# Altium project IOT_V1.5.PrjPcb
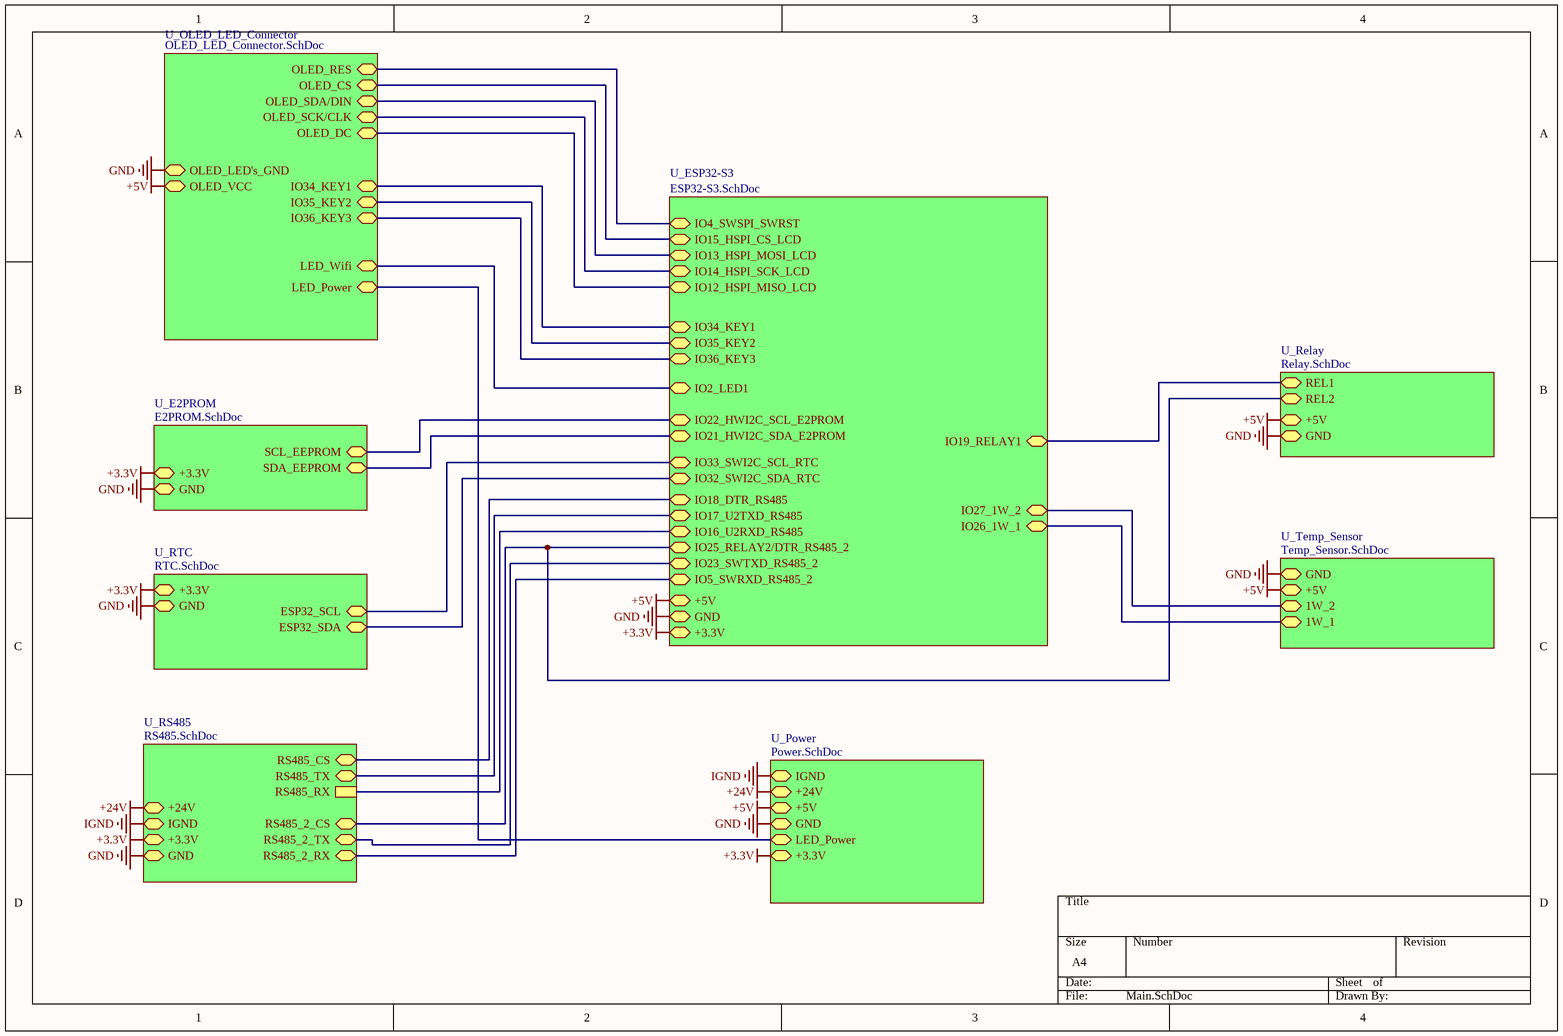
[diagram p0: Main.SchDoc]
9 sheets, 108 parts. Net scope: hierarchical (ports join the sheet entries above them; power ports are global).
Board file: IOTv1.5.PcbDoc
Sheets:
  Main.SchDoc
    U_E2PROM = E2PROM.SchDoc
    U_Power = Power.SchDoc
    U_Relay = Relay.SchDoc
    U_RS485 = RS485.SchDoc
    U_RTC = RTC.SchDoc
    U_Temp_Sensor = Temp_Sensor.SchDoc
    U_OLED_LED_Connector = OLED_LED_Connector.SchDoc
    U_ESP32-S3 = ESP32-S3.SchDoc

## Sheet Main.SchDoc
size A4; SheetNumber: 1; SheetTotal: 12

### Sub-sheets
U_E2PROM = E2PROM.SchDoc: SCL_EEPROM (bidir), SDA_EEPROM (bidir), +3.3V (bidir), GND (bidir)
U_ESP32-S3 = ESP32-S3.SchDoc: IO18_DTR_RS485 (bidir), IO17_U2TXD_RS485 (bidir), IO16_U2RXD_RS485 (bidir), IO22_HWI2C_SCL_E2PROM (bidir), IO21_HWI2C_SDA_E2PROM (bidir), IO32_SWI2C_SDA_RTC (bidir), IO4_SWSPI_SWRST (bidir), IO15_HSPI_CS_LCD (bidir), IO13_HSPI_MOSI_LCD (bidir), IO14_HSPI_SCK_LCD (bidir), IO33_SWI2C_SCL_RTC (bidir), IO2_LED1 (bidir), IO35_KEY2 (bidir), IO36_KEY3 (bidir), IO34_KEY1 (bidir), IO12_HSPI_MISO_LCD (bidir), IO19_RELAY1 (bidir), IO26_1W_1 (bidir), IO27_1W_2 (bidir), +3.3V (bidir), GND (bidir), +5V (bidir), IO25_RELAY2/DTR_RS485_2 (bidir), IO23_SWTXD_RS485_2 (bidir), IO5_SWRXD_RS485_2 (bidir)
U_OLED_LED_Connector = OLED_LED_Connector.SchDoc: OLED_LED's_GND (bidir), OLED_VCC (bidir), OLED_SCK/CLK (bidir), OLED_SDA/DIN (bidir), OLED_RES (bidir), OLED_DC (bidir), OLED_CS (bidir), LED_Power (bidir), LED_Wifi (bidir), IO34_KEY1 (bidir), IO35_KEY2 (bidir), IO36_KEY3 (bidir)
U_Power = Power.SchDoc: IGND (bidir), +24V (bidir), +5V (bidir), GND (bidir), LED_Power (bidir), +3.3V (bidir)
U_Relay = Relay.SchDoc: REL1 (bidir), REL2 (bidir), +5V (bidir), GND (bidir)
U_RS485 = RS485.SchDoc: RS485_CS (bidir), RS485_TX (bidir), RS485_RX, +24V (bidir), IGND (bidir), +3.3V (bidir), GND (bidir), RS485_2_TX (bidir), RS485_2_RX (bidir), RS485_2_CS (bidir)
U_RTC = RTC.SchDoc: +3.3V (bidir), GND (bidir), ESP32_SDA (bidir), ESP32_SCL (bidir)
U_Temp_Sensor = Temp_Sensor.SchDoc: GND (bidir), +5V (bidir), 1W_2 (bidir), 1W_1 (bidir)

### Nets
+3.3V: sheet U_E2PROM/+3.3V, sheet U_Power/LED_Power, sheet U_Power/+3.3V, sheet U_RS485/+3.3V, sheet U_RTC/+3.3V, sheet U_OLED_LED_Connector/LED_Power, sheet U_ESP32-S3/+3.3V
+5V: sheet U_Power/+5V, sheet U_Relay/+5V, sheet U_Temp_Sensor/+5V, sheet U_OLED_LED_Connector/OLED_VCC, sheet U_ESP32-S3/+5V  [project net VCC]
+24V: sheet U_Power/+24V, sheet U_RS485/+24V
GND: sheet U_E2PROM/GND, sheet U_Power/GND, sheet U_Relay/GND, sheet U_RS485/GND, sheet U_RTC/GND, sheet U_Temp_Sensor/GND, sheet U_OLED_LED_Connector/OLED_LED's_GND, sheet U_ESP32-S3/GND
IGND: sheet U_Power/IGND, sheet U_RS485/IGND
1W_1: sheet U_Temp_Sensor/1W_1, sheet U_ESP32-S3/IO26_1W_1
1W_2: sheet U_Temp_Sensor/1W_2, sheet U_ESP32-S3/IO27_1W_2
ESP32_SCL: sheet U_RTC/ESP32_SCL, sheet U_ESP32-S3/IO33_SWI2C_SCL_RTC
ESP32_SDA: sheet U_RTC/ESP32_SDA, sheet U_ESP32-S3/IO32_SWI2C_SDA_RTC
IO2: sheet U_OLED_LED_Connector/LED_Wifi, sheet U_ESP32-S3/IO2_LED1
IO4: sheet U_OLED_LED_Connector/OLED_RES, sheet U_ESP32-S3/IO4_SWSPI_SWRST
IO5: sheet U_RS485/RS485_2_RX, sheet U_ESP32-S3/IO5_SWRXD_RS485_2
IO12: sheet U_OLED_LED_Connector/OLED_DC, sheet U_ESP32-S3/IO12_HSPI_MISO_LCD
IO13: sheet U_OLED_LED_Connector/OLED_SDA/DIN, sheet U_ESP32-S3/IO13_HSPI_MOSI_LCD
IO14: sheet U_OLED_LED_Connector/OLED_SCK/CLK, sheet U_ESP32-S3/IO14_HSPI_SCK_LCD
IO15: sheet U_OLED_LED_Connector/OLED_CS, sheet U_ESP32-S3/IO15_HSPI_CS_LCD
IO16: sheet U_RS485/RS485_RX, sheet U_ESP32-S3/IO16_U2RXD_RS485
IO17: sheet U_RS485/RS485_TX, sheet U_ESP32-S3/IO17_U2TXD_RS485
IO18: sheet U_RS485/RS485_CS, sheet U_ESP32-S3/IO18_DTR_RS485
IO19: sheet U_Relay/REL1, sheet U_ESP32-S3/IO19_RELAY1
IO21: sheet U_E2PROM/SDA_EEPROM, sheet U_ESP32-S3/IO21_HWI2C_SDA_E2PROM
IO22: sheet U_E2PROM/SCL_EEPROM, sheet U_ESP32-S3/IO22_HWI2C_SCL_E2PROM
IO23: sheet U_RS485/RS485_2_TX, sheet U_ESP32-S3/IO23_SWTXD_RS485_2
IO25: sheet U_Relay/REL2, sheet U_RS485/RS485_2_CS, sheet U_ESP32-S3/IO25_RELAY2/DTR_RS485_2
IO34: sheet U_OLED_LED_Connector/IO34_KEY1, sheet U_ESP32-S3/IO34_KEY1
IO35: sheet U_OLED_LED_Connector/IO35_KEY2, sheet U_ESP32-S3/IO35_KEY2
IO36: sheet U_OLED_LED_Connector/IO36_KEY3, sheet U_ESP32-S3/IO36_KEY3

## Sheet E2PROM.SchDoc
size 300 x 200 mm; SheetNumber: 7; SheetTotal: 11
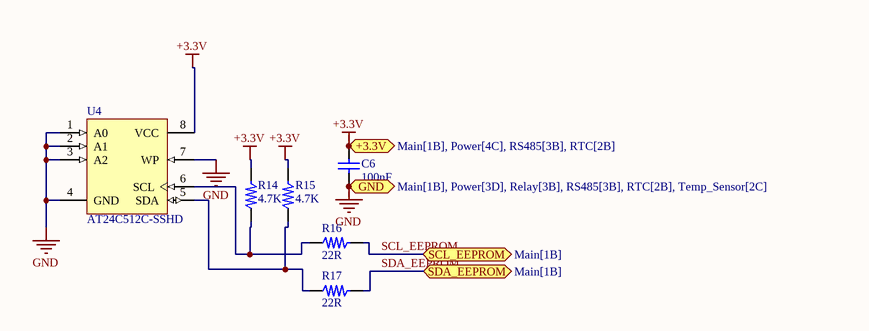
[diagram p1: E2PROM.SchDoc]

### Parts
C6  100nF  [C0805]
R14  4.7K  [R0805]
R15  4.7K  [R0805]
R16  22R  [R0805]
R17  22R  [R0805]
U4  AT24C512C-SSHD  [8S1_N]

### Ports
+3.3V (bidir, see Main[1B], Power[4C], RS485[3B], RTC[2B]), GND (bidir, see Main[1B], Power[3D], Relay[3B], RS485[3B], RTC[2B], Temp_Sensor[2C]), SCL_EEPROM (bidir, see Main[1B]), SDA_EEPROM (bidir, see Main[1B])

### Nets
+3.3V: C6.2 R14.2 R15.2 U4.8(VCC) ; port +3.3V
GND: C6.1 U4.1(A0) U4.2(A1) U4.3(A2) U4.4(GND) U4.7(WP) ; port GND
SCL_EEPROM: R16.2 ; port SCL_EEPROM  [project net IO22]
SDA_EEPROM: R17.2 ; port SDA_EEPROM  [project net IO21]
NetR14_1: R14.1 R16.1 U4.6(SCL)
NetR15_1: R15.1 R17.1 U4.5(SDA)

### Library data of the parts
C6 = 2-Cap: Bipolar Capacitor; Type: MKT
R14-R17 = myRes_1
  R14 R15: Value: 4.7K
  R16 R17: Value: 22R
U4 = AT24C01BN-SP25-B: 1Kbit (128 x 8), 2-wire Bus Automotive Serial EEPROM with Write Protect, 2.5V, 8-Pin SOIC, Bulk; Published: 20-Sep-2010; DatasheetVersion: 8517C,  Jan-2009; PackageVersion: revC, Mar-2005; PackageReference: 8S1; Publisher: Altium Limited; PackageDescription: 8-Lead (0.150" Wide Body), Plastic Gull Wing Small Outline (JEDEC SOIC); Code_JEDEC: MS-012-AA; Code_IPC: SOIC127P600-8; ComponentLink1Description: Manufacturer Link; ComponentLink1URL: http://www.atmel.com/products/serial/default.asp; ComponentLink2Description: Datasheet; ComponentLink2URL: http://www.atmel.com/dyn/resources/prod_documents/doc8517.pdf; ComponentLink3Description: Atmel.com Home; ComponentLink3URL: http://www.atmel.com

## Sheet Power.SchDoc
size 300 x 200 mm; SheetNumber: 12; SheetTotal: 11
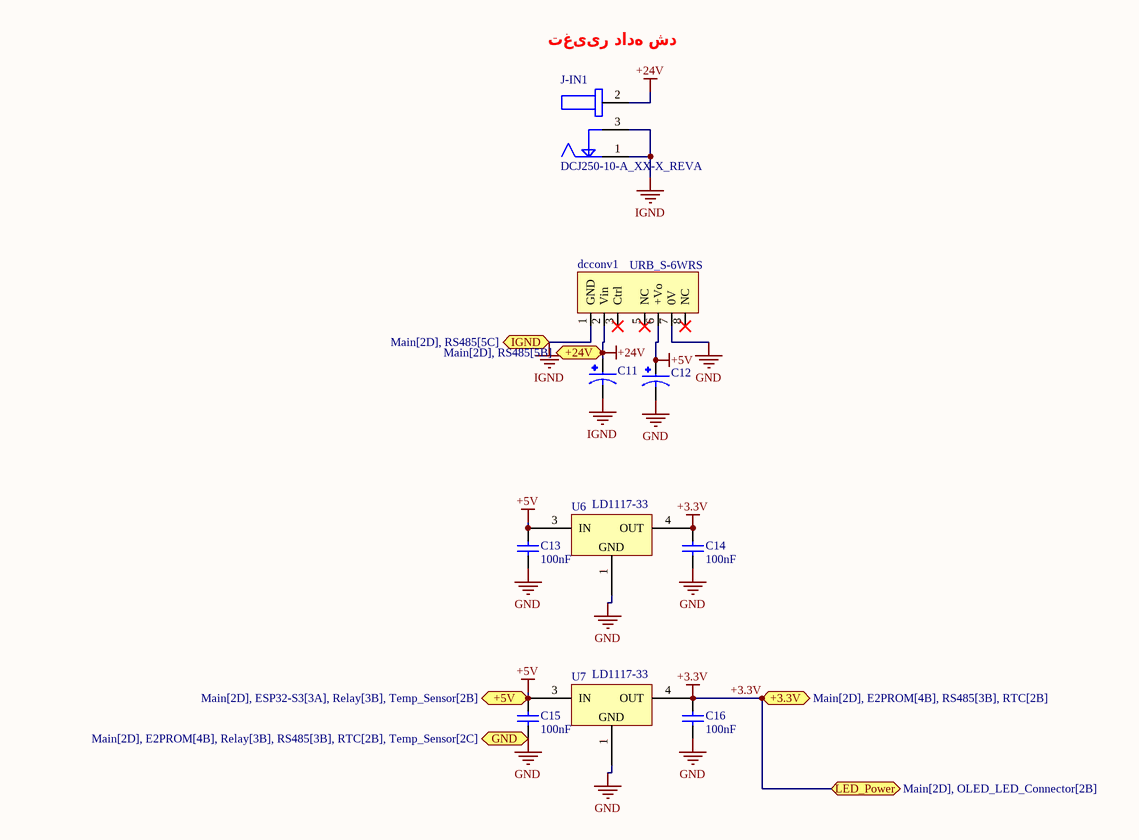
[diagram p2: Power.SchDoc]

### Parts
C11  CAP_EEEFKJ101V  [CAP_EEEFK1J101V]  (value not drawn)
C12  CAP_EEE1EA220AP  [CAP_EEE1EA220AP]  (value not drawn)
C13  100nF  [0805]
C14  100nF  [0805]
C15  100nF  [0805]
C16  100nF  [0805]
dcconv1  URB_S-6WRS  [DCDC]
J-IN1  DCJ250-10-A_XX-X_REVA  [dc power jack]
U6  LD1117-33  [TO-252]
U7  LD1117-33  [TO-252]

### Ports
+3.3V (bidir, see Main[2D], E2PROM[4B], RS485[3B], RTC[2B]), +5V (bidir, see Main[2D], ESP32-S3[3A], Relay[3B], Temp_Sensor[2B]), +24V (bidir, see Main[2D], RS485[5B]), GND (bidir, see Main[2D], E2PROM[4B], Relay[3B], RS485[3B], RTC[2B], Temp_Sensor[2C]), IGND (bidir, see Main[2D], RS485[5C]), LED_Power (bidir, see Main[2D], OLED_LED_Connector[2B])

### Nets
+3.3V: C14.2 C16.2 U6.4(OUT) U7.4(OUT) ; port LED_Power, port +3.3V
+5V: C12.1 C13.2 C15.2 dcconv1.6(+Vo) U6.3(IN) U7.3(IN) ; port +5V  [project net VCC]
+24V: C11.1 dcconv1.2(Vin) J-IN1.2 ; port +24V
GND: C12.2 C13.1 C14.1 C15.1 C16.1 dcconv1.7(0V) U6.1(GND) U7.1(GND) ; port GND
IGND: C11.2 dcconv1.1(GND) J-IN1.1 J-IN1.3 ; port IGND

Not connected (* = marked no-connect by the designer): dcconv1 3(Ctrl)* 5(NC)* 8(NC)*

### Notes on the sheet
- (near J-IN1) تغییر داده شد

### Library data of the parts
C13-C16 = 2-Cap: Bipolar Capacitor; Type: MKT
J-IN1 = DCJ250-10-A_XX-X_REVA: Power Barrel Connector Jack 2.55mm ID _0.100_, 5.50mm OD _0.217_ Through Hole, Right Angle; MP: DCJ250-10-A-K1-K; MF: Global Connector Technology; Availability: Unavailable; Package: None; Value: *; Price: None; SnapEDA_Link: https://www.snapeda.com/parts/DCJ250-10-A-K1-K/Global%20Connector%20Technology/view-part/813036/?ref=snap
U6 U7 = LD1117-33: 3.3V Regulator

## Sheet Relay.SchDoc
size 300 x 200 mm; SheetNumber: 8; SheetTotal: 10
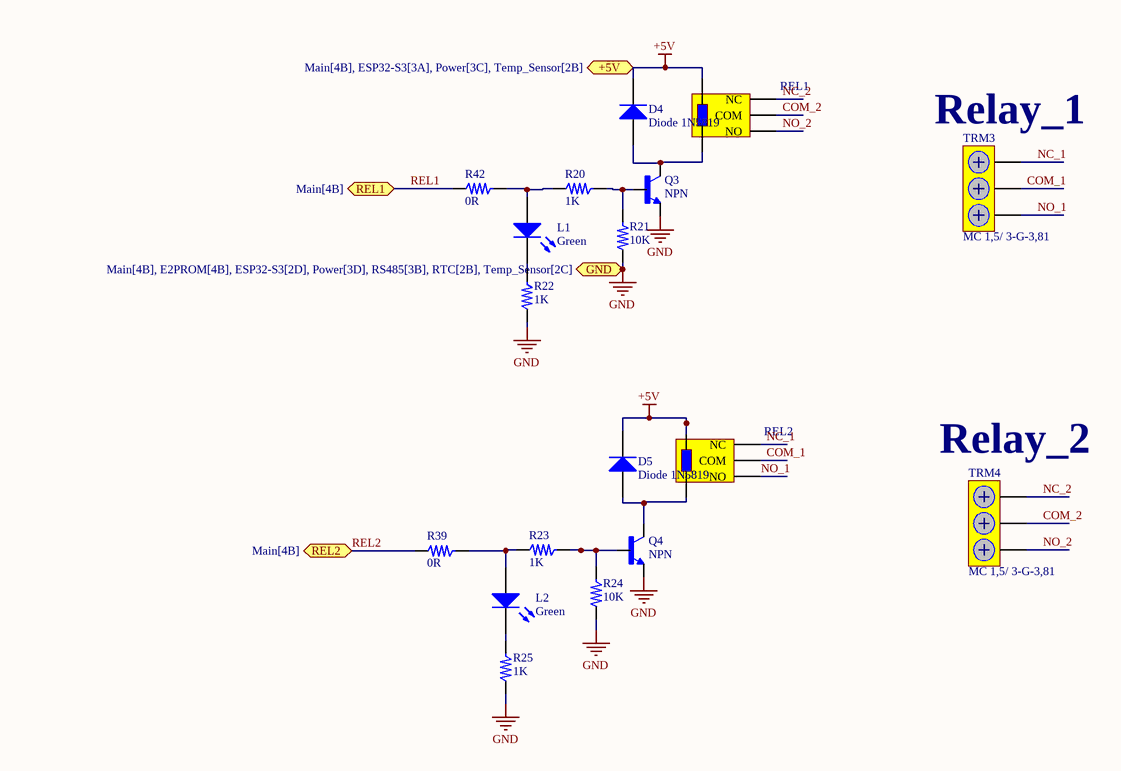
[diagram p3: Relay.SchDoc]

### Parts
D4  Diode 1N5819  [DO-214AA]
D5  Diode 1N5819  [DO-214AA]
L1  Green  [LED-1]
L2  Green  [LED-1]
Q3  NPN  [MMBT2222A]
Q4  NPN  [MMBT2222A]
R20  1K  [R0805]
R21  10K  [R0805]
R22  1K  [R0805]
R23  1K  [R0805]
R24  10K  [R0805]
R25  1K  [R0805]
R39  0R  [R0805]
R42  0R  [R0805]
REL1  Milon mini 5v relay  [HLS-T78-DC5V]  (value not drawn)
REL2  Milon mini 5v relay  [HLS-T78-DC5V]  (value not drawn)
TRM3  MC 1,5/ 3-G-3,81  [MC 1,5/ 3-G-3,81]
TRM4  MC 1,5/ 3-G-3,81  [MC 1,5/ 3-G-3,81]

### Ports
+5V (bidir, see Main[4B], ESP32-S3[3A], Power[3C], Temp_Sensor[2B]), GND (bidir, see Main[4B], E2PROM[4B], ESP32-S3[2D], Power[3D], RS485[3B], RTC[2B], Temp_Sensor[2C]), REL1 (bidir, see Main[4B]), REL2 (bidir, see Main[4B])

### Nets
+5V: D4.2(K) D5.2(K) REL1.3(Coil) REL2.3(Coil) ; port +5V  [project net VCC]
GND: Q3.2(E) Q4.2(E) R21.1 R22.1 R24.1 R25.1 ; port GND
COM_1: REL2.1(COM) TRM3.2
COM_2: REL1.1(COM) TRM4.2
NC_1: REL2.5(NC) TRM3.1
NC_2: REL1.5(NC) TRM4.1
NO_1: REL2.4(NO) TRM3.3
NO_2: REL1.4(NO) TRM4.3
REL1: R42.1 ; port REL1  [project net IO19]
REL2: R39.1 ; port REL2  [project net IO25]
NetD4_1: D4.1(A) Q3.3(C) REL1.2(Coil)
NetD5_1: D5.1(A) Q4.3(C) REL2.2(Coil)
NetL1_1: L1.1(A) R20.1 R42.2
NetL1_2: L1.2(K) R22.2
NetL2_1: L2.1(A) R23.1 R39.2
NetL2_2: L2.2(K) R25.2
NetQ3_1: Q3.1(B) R20.2 R21.2
NetQ4_1: Q4.1(B) R23.2 R24.2

### Notes on the sheet
- (near TRM3) Relay_1
- (near TRM4) Relay_2

### Library data of the parts
D4 D5 = Diode 1N4148: High Conductance Fast Diode; Published: 8-Jun-2000; LatestRevisionDate: 17-Jul-2002; LatestRevisionNote: Re-released for DXP Platform.; DatasheetVersion: 1997; PackageReference: DO-35; Publisher: Altium Limited; PackageDescription: Diode, Axial; Body 3.8 x 1.9 mm (LxDia. max), Lead Dia. 0.53 mm (max); Code_JEDEC: DO-204-AH; ComponentLink1Description: Manufacturer Link; ComponentLink1URL: http://www.fairchildsemi.com/; ComponentLink2Description: Datasheet; ComponentLink2URL: http://www.fairchildsemi.com/ds/1N%2F1N4148.pdf
L1 L2 = LED1_1: LEd 3 mil; Published: 8-Jun-2000; LatestRevisionDate: 08-Jul-2005; LatestRevisionNote: Mech Layer 1 removed.; PackageReference: LED-1; Publisher: Altium Limited; PackageDescription: LED; 2 Leads
Q3 Q4 = MMBT2222A
R20-R25 R39 R42 = myRes_1
  R20 R22 R23 R25: Value: 1K
  R21 R24: Value: 10K
  R39 R42: Value: 0R
REL1 REL2 = HLS-T78

## Sheet RS485.SchDoc
size 300 x 200 mm; SheetNumber: 3; SheetTotal: 10
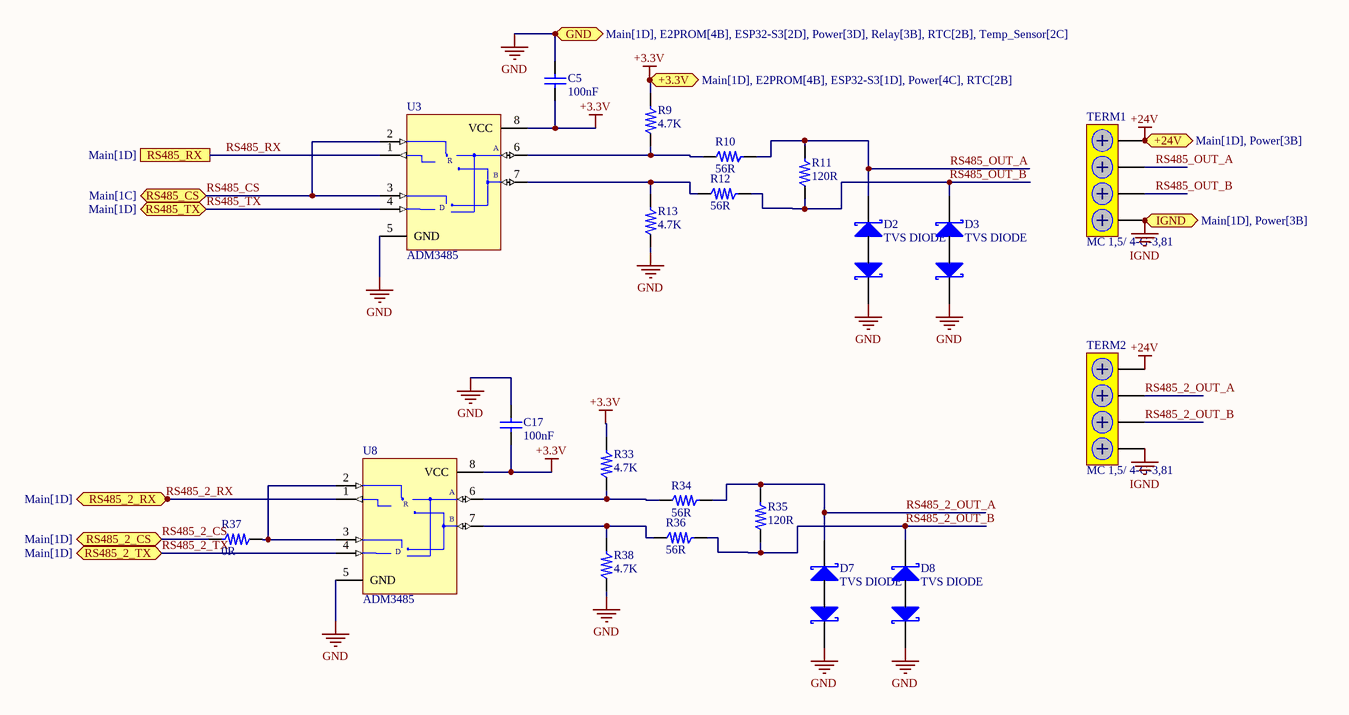
[diagram p4: RS485.SchDoc]

### Parts
C5  100nF  [0805]
C17  100nF  [0805]
D2  TVS DIODE  [DO-214AA]
D3  TVS DIODE  [DO-214AA]
D7  TVS DIODE  [DO-214AA]
D8  TVS DIODE  [DO-214AA]
R9  4.7K  [R0805]
R10  56R  [R0805]
R11  120R  [R0805]
R12  56R  [R0805]
R13  4.7K  [R0805]
R33  4.7K  [R0805]
R34  56R  [R0805]
R35  120R  [R0805]
R36  56R  [R0805]
R37  0R  [R0805]
R38  4.7K  [R0805]
TERM1  MC 1,5/ 4-G-3,81  [MC 1,5/ 4-G-3,81]
TERM2  MC 1,5/ 4-G-3,81  [MC 1,5/ 4-G-3,81]
U3  ADM3485  [NSO8_N]
U8  ADM3485  [NSO8_N]

### Ports
+3.3V (bidir, see Main[1D], E2PROM[4B], ESP32-S3[1D], Power[4C], RTC[2B]), +24V (bidir, see Main[1D], Power[3B]), GND (bidir, see Main[1D], E2PROM[4B], ESP32-S3[2D], Power[3D], Relay[3B], RTC[2B], Temp_Sensor[2C]), IGND (bidir, see Main[1D], Power[3B]), RS485_2_CS (bidir, see Main[1D]), RS485_2_RX (bidir, see Main[1D]), RS485_2_TX (bidir, see Main[1D]), RS485_CS (bidir, see Main[1C]), RS485_RX (see Main[1D]), RS485_TX (bidir, see Main[1D])

### Nets
+3.3V: C5.1 C17.1 R9.2 R33.2 U3.8(VCC) U8.8(VCC) ; port +3.3V
+24V: TERM1.1 TERM2.1 ; port +24V
GND: C5.2 C17.2 D2.1 D3.1 D7.1 D8.1 R13.1 R38.1 U3.5(GND) U8.5(GND) ; port GND
IGND: TERM1.4 TERM2.4 ; port IGND
RS485_2_CS: R37.2 ; port RS485_2_CS  [project net IO25]
RS485_2_OUT_A: D7.2 R34.2 R35.2 TERM2.2
RS485_2_OUT_B: D8.2 R35.1 R36.2 TERM2.3
RS485_2_RX: U8.1(RO) ; port RS485_2_RX  [project net IO5]
RS485_2_TX: U8.4(DI) ; port RS485_2_TX  [project net IO23]
RS485_CS: U3.2(~{RE}) U3.3(DE) ; port RS485_CS  [project net IO18]
RS485_OUT_A: D2.2 R10.2 R11.2 TERM1.2
RS485_OUT_B: D3.2 R11.1 R12.2 TERM1.3
RS485_RX: U3.1(RO) ; port RS485_RX  [project net IO16]
RS485_TX: U3.4(DI) ; port RS485_TX  [project net IO17]
NetR9_1: R9.1 R10.1 U3.6(A)
NetR12_1: R12.1 R13.2 U3.7(B)
NetR33_1: R33.1 R34.1 U8.6(A)
NetR36_1: R36.1 R38.2 U8.7(B)
NetR37_1: R37.1 U8.2(~{RE}) U8.3(DE)

### Notes on the sheet
- (in symbol MAX485CSA) R; D

### Library data of the parts
C5 C17 = 2-Cap: Bipolar Capacitor; Type: MKT
R9-R13 R33-R38 = myRes_1
  R9 R13 R33 R38: Value: 4.7K
  R10 R12 R34 R36: Value: 56R
  R11 R35: Value: 120R
  R37: Value: 0R
U3 U8 = MAX485CSA: Low-Power, Slew-Rate-Limited RS-485/RS-422 Transceiver; Published: 16-Jan-2001; LatestRevisionDate: 13-Apr-2006; LatestRevisionNote: IPC-7351 Footprint Added.; DatasheetVersion: Feb-1996; PackageReference: NSO8; Publisher: Altium Limited; PackageDescription: 8-Pin Small Outline Integrated Circuit 1.27 mm Pitch; Code_JEDEC: MS-012-AA; Code_IPC: SOIC127P600-8; ComponentLink1Description: Manufacturer Link; ComponentLink1URL: http://www.maxim-ic.com/; ComponentLink2Description: Datasheet; ComponentLink2URL: http://pdfserv.maxim-ic.com/en/ds/MAX1487-MAX491.pdf

## Sheet RTC.SchDoc
size A4; SheetNumber: 11; SheetTotal: 11
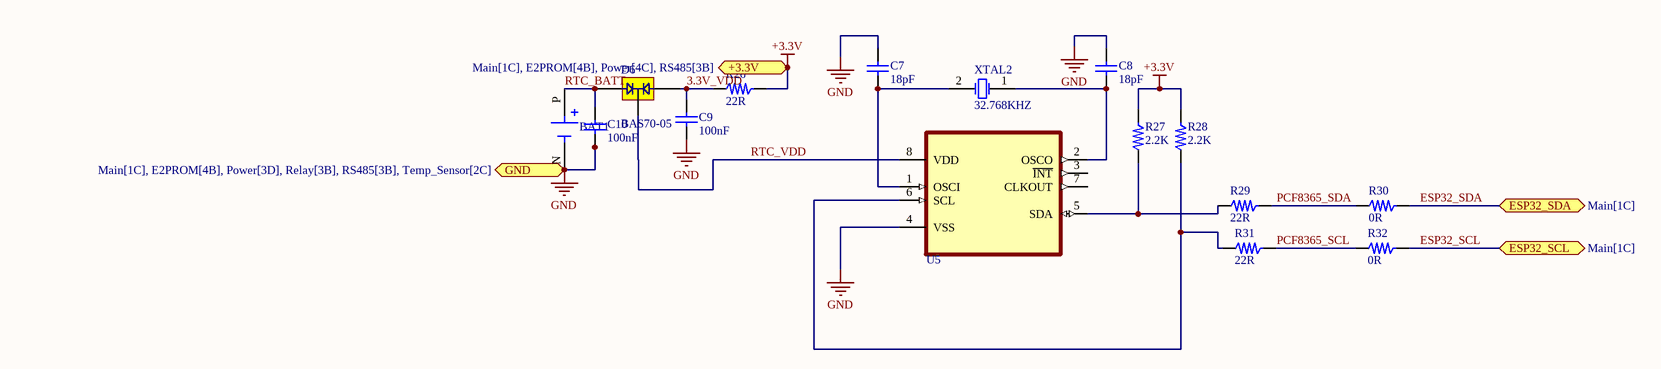
[diagram p5: RTC.SchDoc]

### Parts
BAT1  CR1220  [CR1220]  (value not drawn)
C7  18pF  [0805]
C8  18pF  [0805]
C9  100nF  [0805]
C10  100nF  [0805]
D6  BAS70-05  [BAS70-05]
R26  22R  [R0805]
R27  2.2K  [R0805]
R28  2.2K  [R0805]
R29  22R  [R0805]
R30  0R  [R0805]
R31  22R  [R0805]
R32  0R  [R0805]
U5  RTC  [PCF8563T]  (value not drawn)
XTAL2  32.768KHZ  [R38]

### Ports
+3.3V (bidir, see Main[1C], E2PROM[4B], Power[4C], RS485[3B]), ESP32_SCL (bidir, see Main[1C]), ESP32_SDA (bidir, see Main[1C]), GND (bidir, see Main[1C], E2PROM[4B], Power[3D], Relay[3B], RS485[3B], Temp_Sensor[2C])

### Nets
+3.3V: R26.2 R27.2 R28.2 ; port +3.3V
GND: BAT1.N(NEG) C7.1 C8.1 C9.2 C10.2 U5.4(VSS) ; port GND
3.3V_VDD: C9.1 D6.1 R26.1
ESP32_SCL: R32.2 ; port ESP32_SCL
ESP32_SDA: R30.2 ; port ESP32_SDA
PCF8365_SCL: R31.2 R32.1
PCF8365_SDA: R29.2 R30.1
RTC_BATT: BAT1.P(POS) C10.1 D6.2
RTC_VDD: D6.3 U5.8(VDD)
NetC7_2: C7.2 U5.1(OSCI) XTAL2.2(OSC2)
NetC8_2: C8.2 U5.2(OSCO) XTAL2.1(OSC1)
NetR27_1: R27.1 R29.1 U5.5(SDA)
NetR28_1: R28.1 R31.1 U5.6(SCL)

Not connected (* = marked no-connect by the designer): U5 3(~{INT}) 7(CLKOUT)

### Library data of the parts
BAT1 = CR1220: CR1220 SMD Battery holder
C7-C10 = 2-Cap: Bipolar Capacitor; Type: MKT
D6 = BAS70-05: Common cathode dual schottky diode
R26-R32 = myRes_1
  R26 R29 R31: Value: 22R
  R27 R28: Value: 2.2K
  R30 R32: Value: 0R
U5 = PCF8563T_F4
XTAL2 = XTAL_1: Crystal Oscillator; Published: 8-Jun-2000; LatestRevisionDate: 17-Jul-2002; LatestRevisionNote: Re-released for DXP Platform.; PackageReference: R38; Publisher: Altium Limited

## Sheet Temp_Sensor.SchDoc
size 300 x 200 mm; SheetNumber: 8; SheetTotal: 11
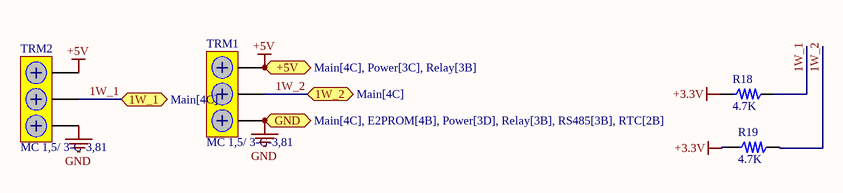
[diagram p6: Temp_Sensor.SchDoc]

### Parts
R18  4.7K  [R0805]
R19  4.7K  [R0805]
TRM1  MC 1,5/ 3-G-3,81  [MC 1,5/ 3-G-3,81]
TRM2  MC 1,5/ 3-G-3,81  [MC 1,5/ 3-G-3,81]

### Ports
1W_1 (bidir, see Main[4C]), 1W_2 (bidir, see Main[4C]), +5V (bidir, see Main[4C], Power[3C], Relay[3B]), GND (bidir, see Main[4C], E2PROM[4B], Power[3D], Relay[3B], RS485[3B], RTC[2B])

### Nets
+3.3V: R18.2 R19.2
+5V: TRM1.1 TRM2.1 ; port +5V  [project net VCC]
GND: TRM1.3 TRM2.3 ; port GND
1W_1: R18.1 TRM2.2 ; port 1W_1
1W_2: R19.1 TRM1.2 ; port 1W_2

### Library data of the parts
R18 R19 = myRes_1: Value: 4.7K

## Sheet OLED_LED_Connector.SchDoc
size A4; SheetNumber: 6; SheetTotal: 12
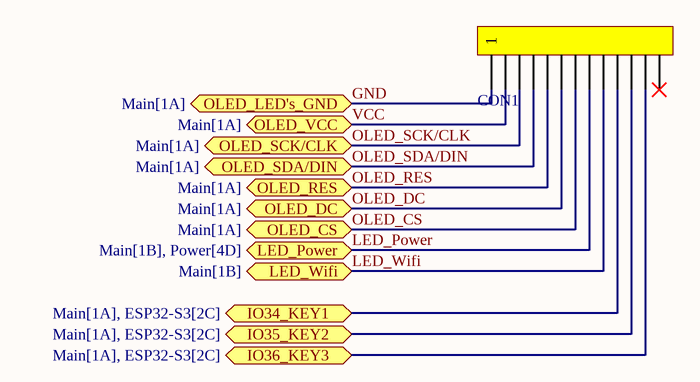
[diagram p7: OLED_LED_Connector.SchDoc]

### Parts
CON1  10 Pin  [Mini SPOX 5267 - 13Pin]  (value not drawn)

### Ports
IO34_KEY1 (bidir, see Main[1A], ESP32-S3[2C]), IO35_KEY2 (bidir, see Main[1A], ESP32-S3[2C]), IO36_KEY3 (bidir, see Main[1A], ESP32-S3[2C]), LED_Power (bidir, see Main[1B], Power[4D]), LED_Wifi (bidir, see Main[1B]), OLED_CS (bidir, see Main[1A]), OLED_DC (bidir, see Main[1A]), OLED_LED's_GND (bidir, see Main[1A]), OLED_RES (bidir, see Main[1A]), OLED_SCK/CLK (bidir, see Main[1A]), OLED_SDA/DIN (bidir, see Main[1A]), OLED_VCC (bidir, see Main[1A])

### Nets
GND: CON1.1 ; port OLED_LED's_GND
LED_Power: CON1.8 ; port LED_Power  [project net +3.3V]
VCC: CON1.2 ; port OLED_VCC
IO34: CON1.10 ; port IO34_KEY1
IO35: CON1.11 ; port IO35_KEY2
IO36: CON1.12 ; port IO36_KEY3
LED_Wifi: CON1.9 ; port LED_Wifi  [project net IO2]
OLED_CS: CON1.7 ; port OLED_CS  [project net IO15]
OLED_DC: CON1.6 ; port OLED_DC  [project net IO12]
OLED_RES: CON1.5 ; port OLED_RES  [project net IO4]
OLED_SCK/CLK: CON1.3 ; port OLED_SCK/CLK  [project net IO14]
OLED_SDA/DIN: CON1.4 ; port OLED_SDA/DIN  [project net IO13]

Not connected (* = marked no-connect by the designer): CON1 13*

### Library data of the parts
CON1 = Mini-SPOX 5267- 13Pin: Mini SPOX 5267 Series / 10 Pin

## Sheet ESP32-S3.SchDoc
size A3; SheetNumber: 2; SheetTotal: 12
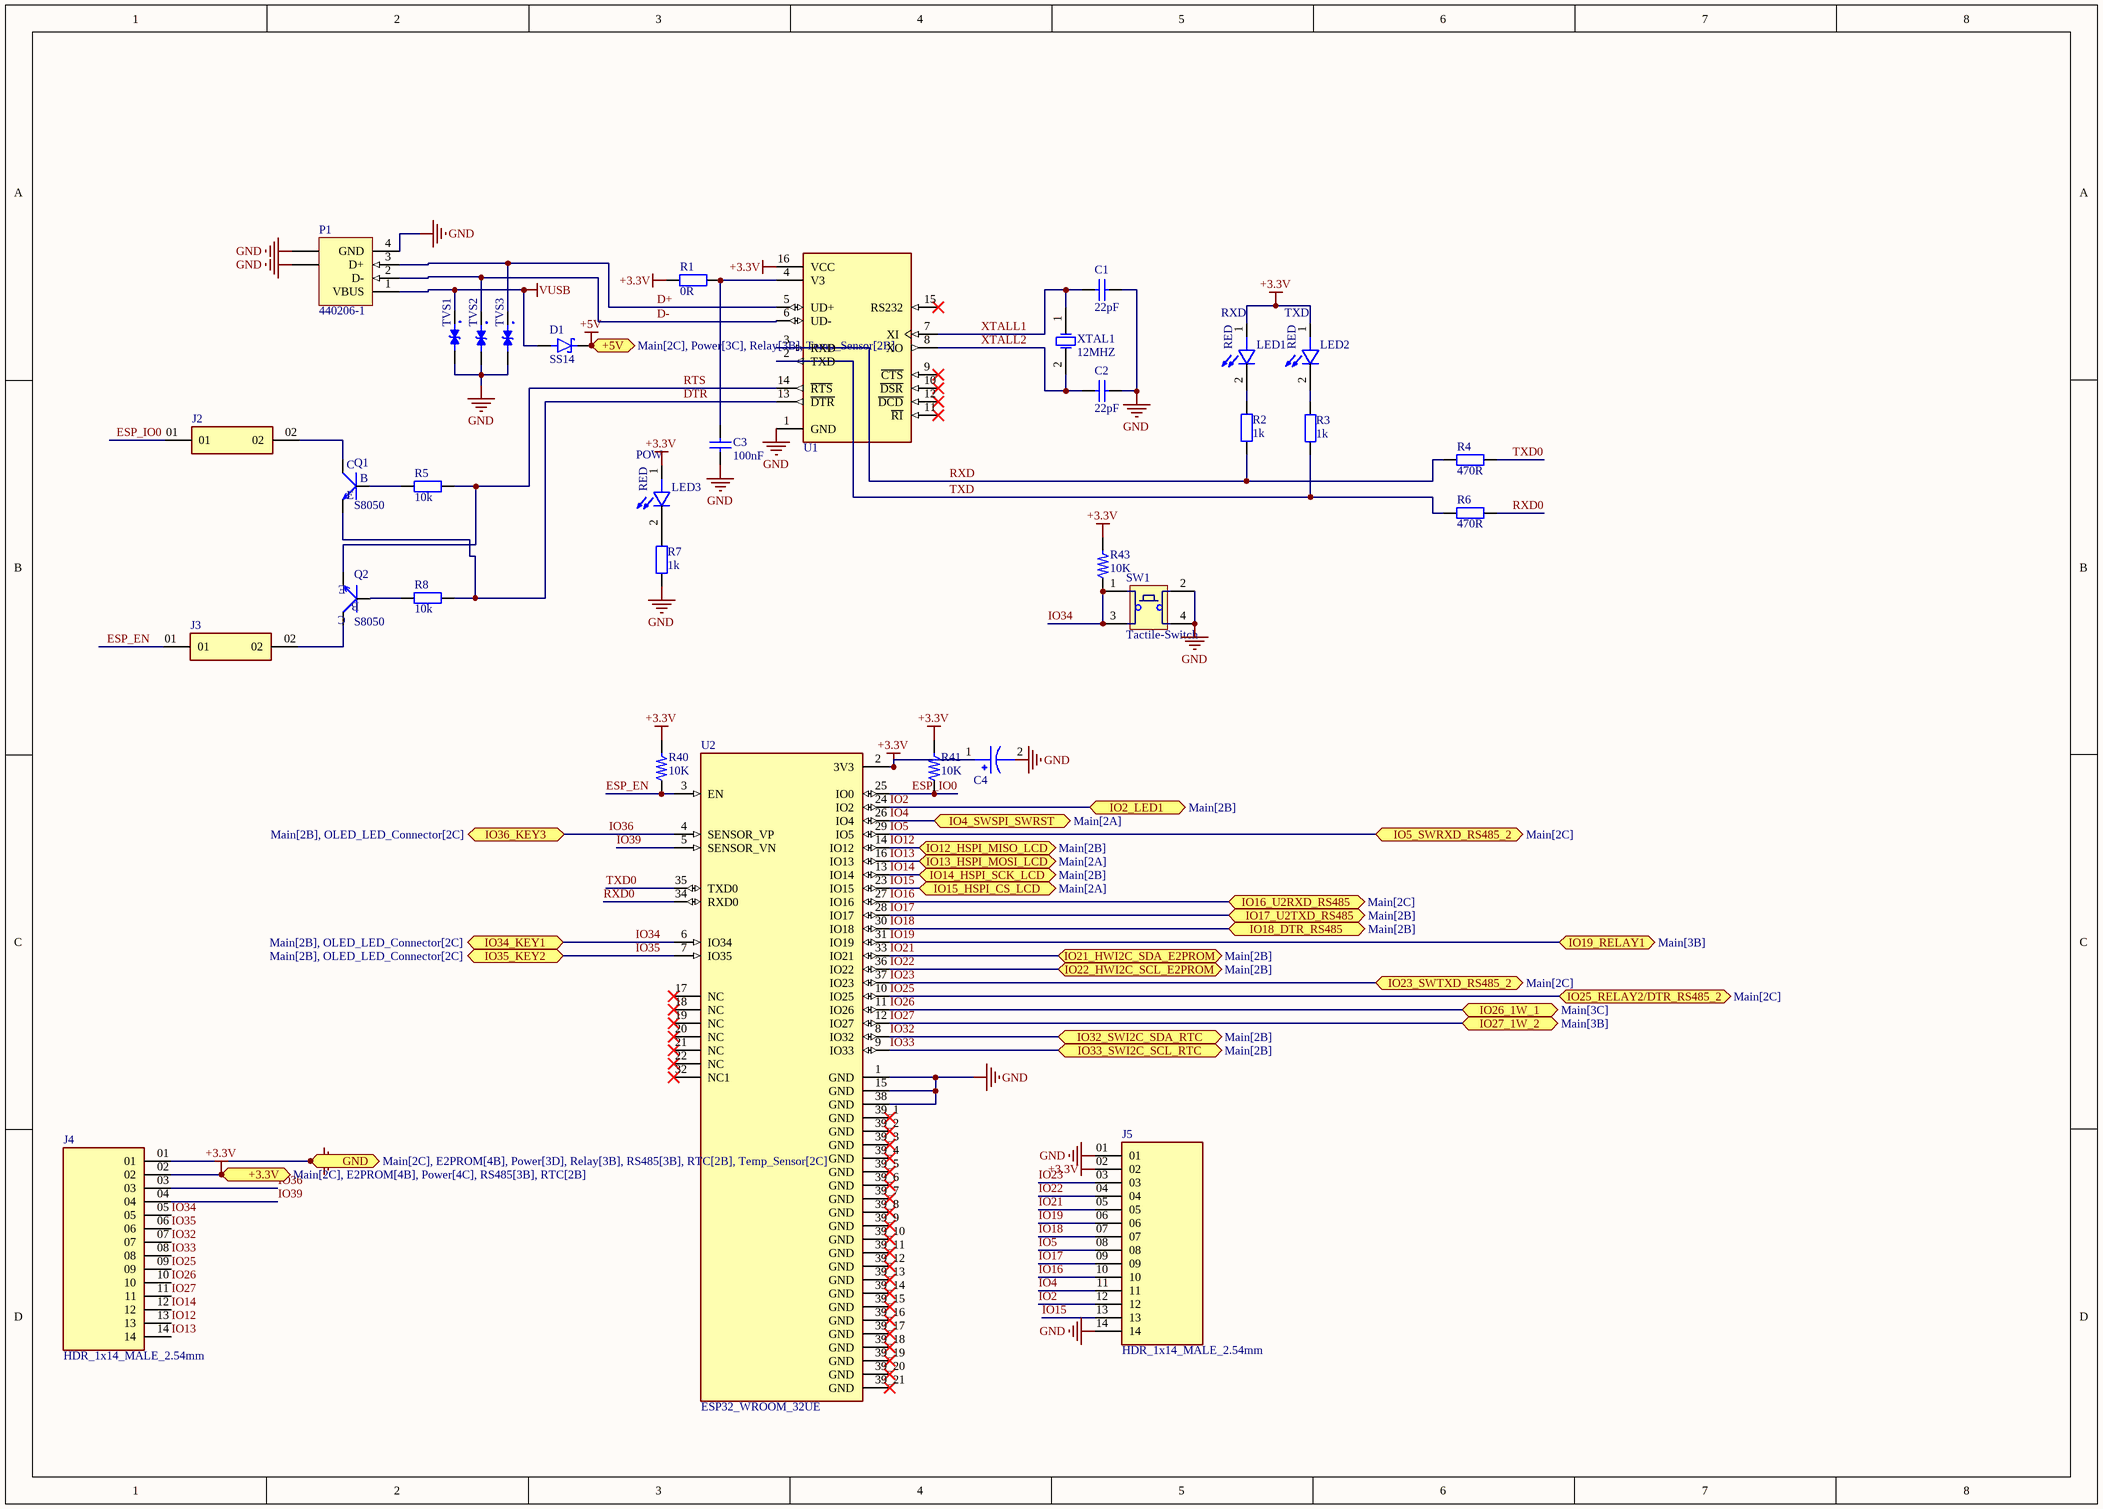
[diagram p8: ESP32-S3.SchDoc]

### Parts
C1  22pF  [0805]
C2  22pF  [0805]
C3  100nF  [0805]
C4  100uf 10V TAN  [TAN_SIZE_A]  (value not drawn)
D1  SS14  [SS14]
J2  HDR_1x2_MALE_2.54mm  [HDR_1x2_MALE_2.54mm]  (value not drawn)
J3  HDR_1x2_MALE_2.54mm  [HDR_1x2_MALE_2.54mm]  (value not drawn)
J4  HDR_1x14_MALE_2.54mm  [HDR_1x14_MALE_2.54mm]
J5  HDR_1x14_MALE_2.54mm  [HDR_1x14_MALE_2.54mm]
LED1  RXD  [LED-0805-G]
LED2  TXD  [LED-0805-G]
LED3  POW  [LED-0805-G]
P1  440206-1  [USB]
Q1  S8050  [S8050]
Q2  S8050  [S8050]
R1  0R  [R0805]
R2  1k  [R0805]
R3  1k  [R0805]
R4  470R  [R0805]
R5  10k  [R0805]
R6  470R  [R0805]
R7  1k  [R0805]
R8  10k  [R0805]
R40  10K  [R0805]
R41  10K  [R0805]
R43  10K  [R0805]
SW1  Tactile-Switch  [SW-Tactile-SMD]
TVS1  LESD5D5.0CT1G  [TVS]  (value not drawn)
TVS2  LESD5D5.0CT1G  [TVS]  (value not drawn)
TVS3  LESD5D5.0CT1G  [TVS]  (value not drawn)
U1  CH340G  [CH340G]  (value not drawn)
U2  ESP32_WROOM_32UE  [ESP32_WROOM_32UE(M113EH6400UH3Q0)]
XTAL1  12MHZ  [XTAL-1]

### Ports
+3.3V (bidir, see Main[2C], E2PROM[4B], Power[4C], RS485[3B], RTC[2B]), +5V (bidir, see Main[2C], Power[3C], Relay[3B], Temp_Sensor[2B]), GND (bidir, see Main[2C], E2PROM[4B], Power[3D], Relay[3B], RS485[3B], RTC[2B], Temp_Sensor[2C]), IO2_LED1 (bidir, see Main[2B]), IO4_SWSPI_SWRST (bidir, see Main[2A]), IO5_SWRXD_RS485_2 (bidir, see Main[2C]), IO12_HSPI_MISO_LCD (bidir, see Main[2B]), IO13_HSPI_MOSI_LCD (bidir, see Main[2A]), IO14_HSPI_SCK_LCD (bidir, see Main[2B]), IO15_HSPI_CS_LCD (bidir, see Main[2A]), IO16_U2RXD_RS485 (bidir, see Main[2C]), IO17_U2TXD_RS485 (bidir, see Main[2B]), IO18_DTR_RS485 (bidir, see Main[2B]), IO19_RELAY1 (bidir, see Main[3B]), IO21_HWI2C_SDA_E2PROM (bidir, see Main[2B]), IO22_HWI2C_SCL_E2PROM (bidir, see Main[2B]), IO23_SWTXD_RS485_2 (bidir, see Main[2C]), IO25_RELAY2/DTR_RS485_2 (bidir, see Main[2C]), IO26_1W_1 (bidir, see Main[3C]), IO27_1W_2 (bidir, see Main[3B]), IO32_SWI2C_SDA_RTC (bidir, see Main[2B]), IO33_SWI2C_SCL_RTC (bidir, see Main[2B]), IO34_KEY1 (bidir, see Main[2B], OLED_LED_Connector[2C]), IO35_KEY2 (bidir, see Main[2B], OLED_LED_Connector[2C]), IO36_KEY3 (bidir, see Main[2B], OLED_LED_Connector[2C])

### Nets
+3.3V: C4.1 J4.02 J5.02 LED1.1 LED2.1 LED3.1 R1.1 R40.2 R41.2 R43.2 U1.16(VCC) U2.2(3V3) ; port +3.3V
+5V: D1.C(K) ; port +5V  [project net VCC]
GND: C1.1 C2.1 C3.1 C4.2 J4.01 J5.01 J5.14 P1.4(GND) P1.5(SHLD) P1.6(SHLD) R7.2 SW1.2 SW1.4 TVS1.2 TVS2.2 TVS3.2 U1.1(GND) U2.1(GND) U2.15(GND) U2.38(GND) ; port GND
VUSB: D1.A P1.1(VBUS) TVS1.1
D+: P1.3(D+) TVS3.1 U1.5(UD+)
D-: P1.2(D-) TVS2.1 U1.6(UD-)
DTR: Q1.2(E) R8.1 U1.13(~{DTR})
ESP_EN: J3.01 R40.1 U2.3(EN)
ESP_IO0: J2.01 R41.1 U2.25(IO0)
IO2: J5.12 U2.24(IO2) ; port IO2_LED1
IO4: J5.11 U2.26(IO4) ; port IO4_SWSPI_SWRST
IO5: J5.08 U2.29(IO5) ; port IO5_SWRXD_RS485_2
IO12: J4.13 U2.14(IO12) ; port IO12_HSPI_MISO_LCD
IO13: J4.14 U2.16(IO13) ; port IO13_HSPI_MOSI_LCD
IO14: J4.12 U2.13(IO14) ; port IO14_HSPI_SCK_LCD
IO15: J5.13 U2.23(IO15) ; port IO15_HSPI_CS_LCD
IO16: J5.10 U2.27(IO16) ; port IO16_U2RXD_RS485
IO17: J5.09 U2.28(IO17) ; port IO17_U2TXD_RS485
IO18: J5.07 U2.30(IO18) ; port IO18_DTR_RS485
IO19: J5.06 U2.31(IO19) ; port IO19_RELAY1
IO21: J5.05 U2.33(IO21) ; port IO21_HWI2C_SDA_E2PROM
IO22: J5.04 U2.36(IO22) ; port IO22_HWI2C_SCL_E2PROM
IO23: J5.03 U2.37(IO23) ; port IO23_SWTXD_RS485_2
IO25: J4.09 U2.10(IO25) ; port IO25_RELAY2/DTR_RS485_2
IO26: J4.10 U2.11(IO26) ; port IO26_1W_1  [project net 1W_1]
IO27: J4.11 U2.12(IO27) ; port IO27_1W_2  [project net 1W_2]
IO32: J4.07 U2.8(IO32) ; port IO32_SWI2C_SDA_RTC  [project net ESP32_SDA]
IO33: J4.08 U2.9(IO33) ; port IO33_SWI2C_SCL_RTC  [project net ESP32_SCL]
IO34: J4.05 R43.1 SW1.1 SW1.3 U2.6(IO34) ; port IO34_KEY1
IO35: J4.06 U2.7(IO35) ; port IO35_KEY2
IO36: J4.03 U2.4(SENSOR_VP) ; port IO36_KEY3
IO39: J4.04 U2.5(SENSOR_VN)
RTS: Q2.2(E) R5.1 U1.14(~{RTS})
RXD: R2.2 R4.1 U1.3(RXD)
RXD0: R6.2 U2.34(RXD0)
TXD: R3.2 R6.1 U1.2(TXD)
TXD0: R4.2 U2.35(TXD0)
XTALL1: C1.2 U1.7(XI) XTAL1.1(OSC1)
XTALL2: C2.2 U1.8(XO) XTAL1.2(OSC2)
NetC3_2: C3.2 R1.2 U1.4(V3)
NetJ2_02: J2.02 Q1.3(C)
NetJ3_02: J3.02 Q2.3(C)
NetLED1_2: LED1.2 R2.1
NetLED2_2: LED2.2 R3.1
NetLED3_2: LED3.2 R7.1
NetQ1_1: Q1.1(B) R5.2
NetQ2_1: Q2.1(B) R8.2

Not connected (* = marked no-connect by the designer): U1 9(~{CTS})* 10(~{DSR})* 11(~{RI})* 12(~{DCD})* 15(RS232)*; U2 17(NC)* 18(NC)* 19(NC)* 20(NC)* 21(NC)* 22(NC)* 32(NC1)* 39_1(GND)* 39_2(GND)* 39_3(GND)* 39_4(GND)* 39_5(GND)* 39_6(GND)* 39_7(GND)* 39_8(GND)* 39_9(GND)* 39_10(GND)* 39_11(GND)* 39_12(GND)* 39_13(GND)* 39_14(GND)* 39_15(GND)* 39_16(GND)* 39_17(GND)* 39_18(GND)* 39_19(GND)* 39_20(GND)* 39_21(GND)*

### Notes on the sheet
- (in symbol LED_0805) RED

### Library data of the parts
C1 C2 = 2-Cap_4: Bipolar Capacitor; Type: MKT
C3 = Cap_2: Capacitor; Published: 8-Jun-2000; LatestRevisionDate: 17-Jul-2002; LatestRevisionNote: Re-released for DXP Platform.; PackageReference: RAD-0.3; Publisher: Altium Limited
LED1-LED3 = LED_0805
P1 = 440206-1: USB 1.1, Vertical, Thru-Hole, B Type, Receptacle, 4 Position, White; ContactMaterial: Copper Alloy; ContactPlating: Gold (30) over Nickel; TerminationLength: 2.84mm [0.112in.]; PCB_Layout: Complies with manufacturer's recommendation.; DrillSize: Corresponds to nominal value.; PanelGround: Without; Published: 15-Jul-2004; DatasheetDocument: 04-May-2001; PackageDocument: 04-May-2001; PackageReference: 440206; Publisher: Altium Limited; HousingMaterial: Thermoplastic; ComponentLink1Description: Manufacturer Link; ComponentLink1URL: http://www.tycoelectronics.com/; ComponentLink2Description: Packaging Specification; ComponentLink2URL: http://ecommas.tycoelectronics.com/commerce/DocumentDelivery/DDEController?Action=showdoc&DocId=Customer+Drawing%7F440206%7FA%7Ftif%7FEnglish%7FC_440206_A.tif
R1-R8 = Res2: Resistor; Published: 8-Jun-2000; LatestRevisionDate: 17-Jul-2002; LatestRevisionNote: Re-released for DXP Platform.; PackageReference: AXIAL-0.4; Publisher: Altium Limited
R40 R41 R43 = myRes_1: Value: 10K
TVS1-TVS3 = TVS 5V
U1 = CH340G: USB to Serial Converter
XTAL1 = XTAL: Crystal Oscillator; Published: 8-Jun-2000; LatestRevisionDate: 17-Jul-2002; LatestRevisionNote: Re-released for DXP Platform.; PackageReference: R38; Publisher: Altium Limited

## Nets that join several sheets
+3.3V: E2PROM (C6.2 R14.2 R15.2 U4.8), Power (C14.2 C16.2 U6.4 U7.4), RS485 (6 pins), RTC (R26.2 R27.2 R28.2), Temp_Sensor (R18.2 R19.2), OLED_LED_Connector (CON1.8), ESP32-S3 (12 pins)
+24V: Power (C11.1 dcconv1.2 J-IN1.2), RS485 (TERM1.1 TERM2.1)
GND: E2PROM (6 pins), Power (8 pins), Relay (6 pins), RS485 (10 pins), RTC (6 pins), Temp_Sensor (TRM1.3 TRM2.3), OLED_LED_Connector (CON1.1), ESP32-S3 (20 pins)
IGND: Power (C11.2 dcconv1.1 J-IN1.1 J-IN1.3), RS485 (TERM1.4 TERM2.4)
VCC: Power (6 pins), Relay (D4.2 D5.2 REL1.3 REL2.3), Temp_Sensor (TRM1.1 TRM2.1), OLED_LED_Connector (CON1.2), ESP32-S3 (D1.C)
1W_1: Temp_Sensor (R18.1 TRM2.2), ESP32-S3 (J4.10 U2.11)
1W_2: Temp_Sensor (R19.1 TRM1.2), ESP32-S3 (J4.11 U2.12)
ESP32_SCL: RTC (R32.2), ESP32-S3 (J4.08 U2.9)
ESP32_SDA: RTC (R30.2), ESP32-S3 (J4.07 U2.8)
IO2: OLED_LED_Connector (CON1.9), ESP32-S3 (J5.12 U2.24)
IO4: OLED_LED_Connector (CON1.5), ESP32-S3 (J5.11 U2.26)
IO5: RS485 (U8.1), ESP32-S3 (J5.08 U2.29)
IO12: OLED_LED_Connector (CON1.6), ESP32-S3 (J4.13 U2.14)
IO13: OLED_LED_Connector (CON1.4), ESP32-S3 (J4.14 U2.16)
IO14: OLED_LED_Connector (CON1.3), ESP32-S3 (J4.12 U2.13)
IO15: OLED_LED_Connector (CON1.7), ESP32-S3 (J5.13 U2.23)
IO16: RS485 (U3.1), ESP32-S3 (J5.10 U2.27)
IO17: RS485 (U3.4), ESP32-S3 (J5.09 U2.28)
IO18: RS485 (U3.2 U3.3), ESP32-S3 (J5.07 U2.30)
IO19: Relay (R42.1), ESP32-S3 (J5.06 U2.31)
IO21: E2PROM (R17.2), ESP32-S3 (J5.05 U2.33)
IO22: E2PROM (R16.2), ESP32-S3 (J5.04 U2.36)
IO23: RS485 (U8.4), ESP32-S3 (J5.03 U2.37)
IO25: Relay (R39.1), RS485 (R37.2), ESP32-S3 (J4.09 U2.10)
IO34: OLED_LED_Connector (CON1.10), ESP32-S3 (5 pins)
IO35: OLED_LED_Connector (CON1.11), ESP32-S3 (J4.06 U2.7)
IO36: OLED_LED_Connector (CON1.12), ESP32-S3 (J4.03 U2.4)